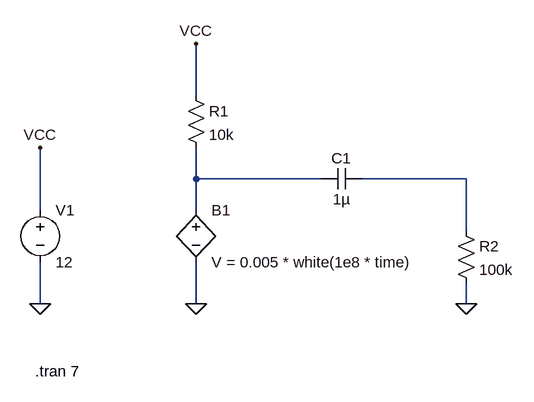
[diagram p0: schematic Random.asc]
Random.asc, the LTspice schematic file:
Version 4.1
SHEET 1 880 680
WIRE 32 -48 32 -128
WIRE 32 80 32 32
WIRE 224 80 32 80
WIRE 448 80 288 80
WIRE -208 128 -208 32
WIRE 32 128 32 80
WIRE 448 160 448 80
WIRE -208 272 -208 208
WIRE 32 272 32 208
WIRE 448 272 448 240
FLAG 32 272 0
FLAG 448 272 0
FLAG 32 -128 VCC
FLAG -208 272 0
FLAG -208 32 VCC
SYMBOL res 16 -64 R0
SYMATTR InstName R1
SYMATTR Value 10k
SYMBOL cap 288 64 R90
WINDOW 0 0 32 VBottom 2
WINDOW 3 32 32 VTop 2
SYMATTR InstName C1
SYMATTR Value 1µ
SYMBOL res 432 144 R0
SYMATTR InstName R2
SYMATTR Value 100k
SYMBOL voltage -208 112 R0
WINDOW 123 0 0 Left 0
WINDOW 39 0 0 Left 0
SYMATTR InstName V1
SYMATTR Value 12
SYMBOL bv 32 112 R0
SYMATTR InstName B1
SYMATTR Value V = 0.005 * white(1e8 * time)
TEXT -216 376 Left 2 !.tran 7

The netlist it stands for:
* Random.asc
R1 VCC N001 10k
C1 N002 N001 1µ
R2 N002 0 100k
V1 VCC 0 12
B1 N001 0 V = 0.005 * white(1e8 * time)
.tran 7
.backanno
.end